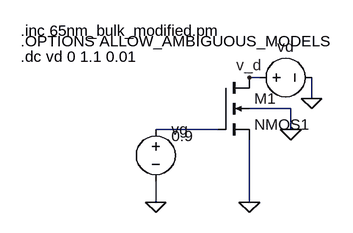
[diagram p0: schematic idvd.asc]
idvd.asc, the LTspice schematic file:
Version 4.1
SHEET 1 880 680
WIRE 256 176 240 176
WIRE 336 208 336 176
WIRE 304 224 240 224
WIRE 192 256 96 256
WIRE 304 256 304 224
WIRE 96 368 96 336
WIRE 240 368 240 272
FLAG 96 368 0
FLAG 240 368 0
FLAG 336 208 0
FLAG 304 256 0
FLAG 240 176 v_d
SYMBOL nmos4 192 176 R0
SYMATTR InstName M1
SYMATTR Value2 l=70nm w=1um
SYMATTR Value NMOS1
SYMBOL voltage 96 240 R0
WINDOW 123 0 0 Left 0
WINDOW 39 0 0 Left 0
WINDOW 3 24 26 Left 2
SYMATTR Value 0.9
SYMATTR InstName vg
SYMBOL voltage 240 176 R270
WINDOW 0 32 56 VTop 2
WINDOW 3 22 56 VTop 2
WINDOW 123 0 0 Left 0
WINDOW 39 0 0 Left 0
SYMATTR InstName vd
SYMATTR Value ""
TEXT -112 104 Left 2 !.inc 65nm_bulk_modified.pm
TEXT -112 120 Left 2 !.OPTIONS ALLOW_AMBIGUOUS_MODELS
TEXT -112 144 Left 2 !.dc vd 0 1.1 0.01

The netlist it stands for:
* idvd.asc
M1 v_d N001 0 0 NMOS1 l=70nm w=1um
vg N001 0 0.9
vd v_d 0
.model NMOS NMOS
.model PMOS PMOS
.lib standard.mos
.inc 65nm_bulk_modified.pm
.OPTIONS ALLOW_AMBIGUOUS_MODELS
.dc vd 0 1.1 0.01
.backanno
.end

* Results of the author's LTspice run, read from the files saved beside the schematic
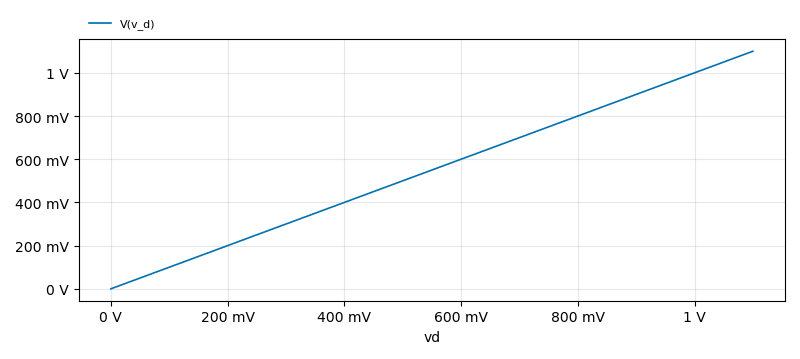
[diagram p1: DC transfer characteristic of idvd.asc, plotted from the saved traces]
* DC transfer characteristic, 1 run:
*   V(v_d): 0 V at vd=0 V, 1.1 V at vd=1.1 V, min 0 V, max 1.1 V